# EAGLE design bus (EAGLE 4.16)
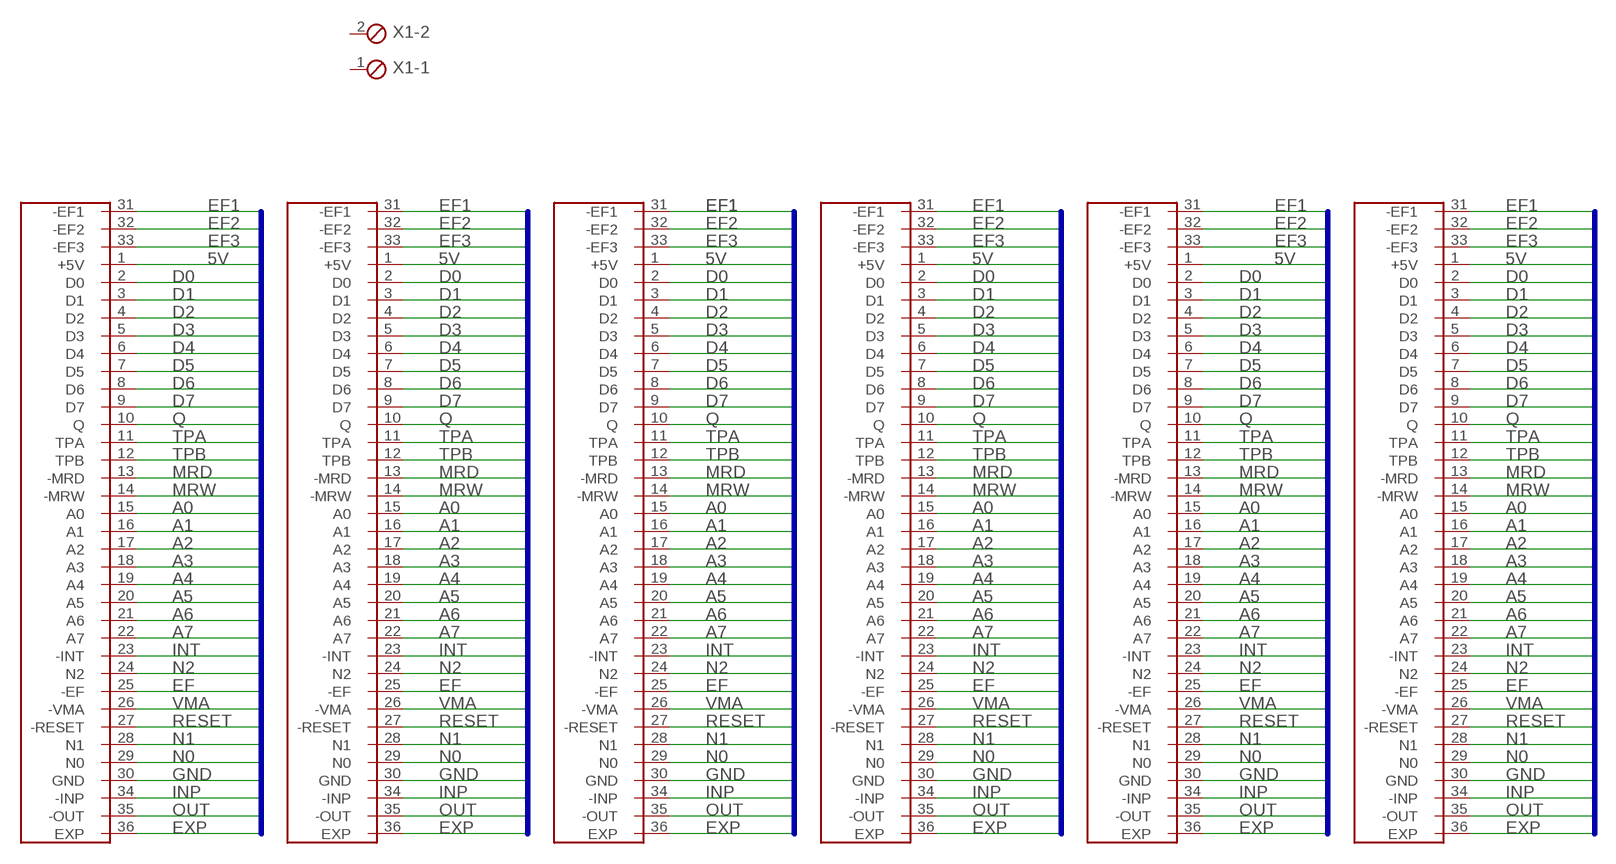
[diagram p0: schematic, sheet 1]

## Parts
U$1  C36A  [C36A]
U$2  C36A  [C36A]
U$3  C36A  [C36A]
U$4  C36A  [C36A]
U$5  C36A  [C36A]
U$6  C36A  [C36A]
X1  MPT2  [2POL254]

## Nets
5V: U$1.1(+5V) U$2.1(+5V) U$3.1(+5V) U$4.1(+5V) U$5.1(+5V) U$6.1(+5V)
A0: U$1.15(A0) U$2.15(A0) U$3.15(A0) U$4.15(A0) U$5.15(A0) U$6.15(A0)
A1: U$1.16(A1) U$2.16(A1) U$3.16(A1) U$4.16(A1) U$5.16(A1) U$6.16(A1)
A2: U$1.17(A2) U$2.17(A2) U$3.17(A2) U$4.17(A2) U$5.17(A2) U$6.17(A2)
A3: U$1.18(A3) U$2.18(A3) U$3.18(A3) U$4.18(A3) U$5.18(A3) U$6.18(A3)
A4: U$1.19(A4) U$2.19(A4) U$3.19(A4) U$4.19(A4) U$5.19(A4) U$6.19(A4)
A5: U$1.20(A5) U$2.20(A5) U$3.20(A5) U$4.20(A5) U$5.20(A5) U$6.20(A5)
A6: U$1.21(A6) U$2.21(A6) U$3.21(A6) U$4.21(A6) U$5.21(A6) U$6.21(A6)
A7: U$1.22(A7) U$2.22(A7) U$3.22(A7) U$4.22(A7) U$5.22(A7) U$6.22(A7)
D0: U$1.2(D0) U$2.2(D0) U$3.2(D0) U$4.2(D0) U$5.2(D0) U$6.2(D0)
D1: U$1.3(D1) U$2.3(D1) U$3.3(D1) U$4.3(D1) U$5.3(D1) U$6.3(D1)
D2: U$1.4(D2) U$2.4(D2) U$3.4(D2) U$4.4(D2) U$5.4(D2) U$6.4(D2)
D3: U$1.5(D3) U$2.5(D3) U$3.5(D3) U$4.5(D3) U$5.5(D3) U$6.5(D3)
D4: U$1.6(D4) U$2.6(D4) U$3.6(D4) U$4.6(D4) U$5.6(D4) U$6.6(D4)
D5: U$1.7(D5) U$2.7(D5) U$3.7(D5) U$4.7(D5) U$5.7(D5) U$6.7(D5)
D6: U$1.8(D6) U$2.8(D6) U$3.8(D6) U$4.8(D6) U$5.8(D6) U$6.8(D6)
D7: U$1.9(D7) U$2.9(D7) U$3.9(D7) U$4.9(D7) U$5.9(D7) U$6.9(D7)
EF: U$1.25(-EF) U$2.25(-EF) U$3.25(-EF) U$4.25(-EF) U$5.25(-EF) U$6.25(-EF)
EF1: U$1.31(-EF1) U$2.31(-EF1) U$3.31(-EF1) U$4.31(-EF1) U$5.31(-EF1) U$6.31(-EF1)
EF2: U$1.32(-EF2) U$2.32(-EF2) U$3.32(-EF2) U$4.32(-EF2) U$5.32(-EF2) U$6.32(-EF2)
EF3: U$1.33(-EF3) U$2.33(-EF3) U$3.33(-EF3) U$4.33(-EF3) U$5.33(-EF3) U$6.33(-EF3)
EXP: U$1.36(EXP) U$2.36(EXP) U$3.36(EXP) U$4.36(EXP) U$5.36(EXP) U$6.36(EXP)
GND: U$1.30(GND) U$2.30(GND) U$3.30(GND) U$4.30(GND) U$5.30(GND) U$6.30(GND)
INP: U$1.34(-INP) U$2.34(-INP) U$3.34(-INP) U$4.34(-INP) U$5.34(-INP) U$6.34(-INP)
INT: U$1.23(-INT) U$2.23(-INT) U$3.23(-INT) U$4.23(-INT) U$5.23(-INT) U$6.23(-INT)
MRD: U$1.13(-MRD) U$2.13(-MRD) U$3.13(-MRD) U$4.13(-MRD) U$5.13(-MRD) U$6.13(-MRD)
MRW: U$1.14(-MRW) U$2.14(-MRW) U$3.14(-MRW) U$4.14(-MRW) U$5.14(-MRW) U$6.14(-MRW)
N0: U$1.29(N0) U$2.29(N0) U$3.29(N0) U$4.29(N0) U$5.29(N0) U$6.29(N0)
N1: U$1.28(N1) U$2.28(N1) U$3.28(N1) U$4.28(N1) U$5.28(N1) U$6.28(N1)
N2: U$1.24(N2) U$2.24(N2) U$3.24(N2) U$4.24(N2) U$5.24(N2) U$6.24(N2)
OUT: U$1.35(-OUT) U$2.35(-OUT) U$3.35(-OUT) U$4.35(-OUT) U$5.35(-OUT) U$6.35(-OUT)
Q: U$1.10(Q) U$2.10(Q) U$3.10(Q) U$4.10(Q) U$5.10(Q) U$6.10(Q)
RESET: U$1.27(-RESET) U$2.27(-RESET) U$3.27(-RESET) U$4.27(-RESET) U$5.27(-RESET) U$6.27(-RESET)
TPA: U$1.11(TPA) U$2.11(TPA) U$3.11(TPA) U$4.11(TPA) U$5.11(TPA) U$6.11(TPA)
TPB: U$1.12(TPB) U$2.12(TPB) U$3.12(TPB) U$4.12(TPB) U$5.12(TPB) U$6.12(TPB)
VMA: U$1.26(-VMA) U$2.26(-VMA) U$3.26(-VMA) U$4.26(-VMA) U$5.26(-VMA) U$6.26(-VMA)
Unconnected: X1.1 X1.2

## Buses
5V,GND,D[0..7],Q,TPA,TPB,MRD,MRW,A[0..7],INT,EF,VMA,RESET,N0,N1,N2,EF1,EF2,EF3,INP,OUT,IOM

## Library data of the parts
U$1-U$6 = k1:C36A
X1 = con-phoenix-254:MPT2: PHOENIX CONNECTOR

## Board
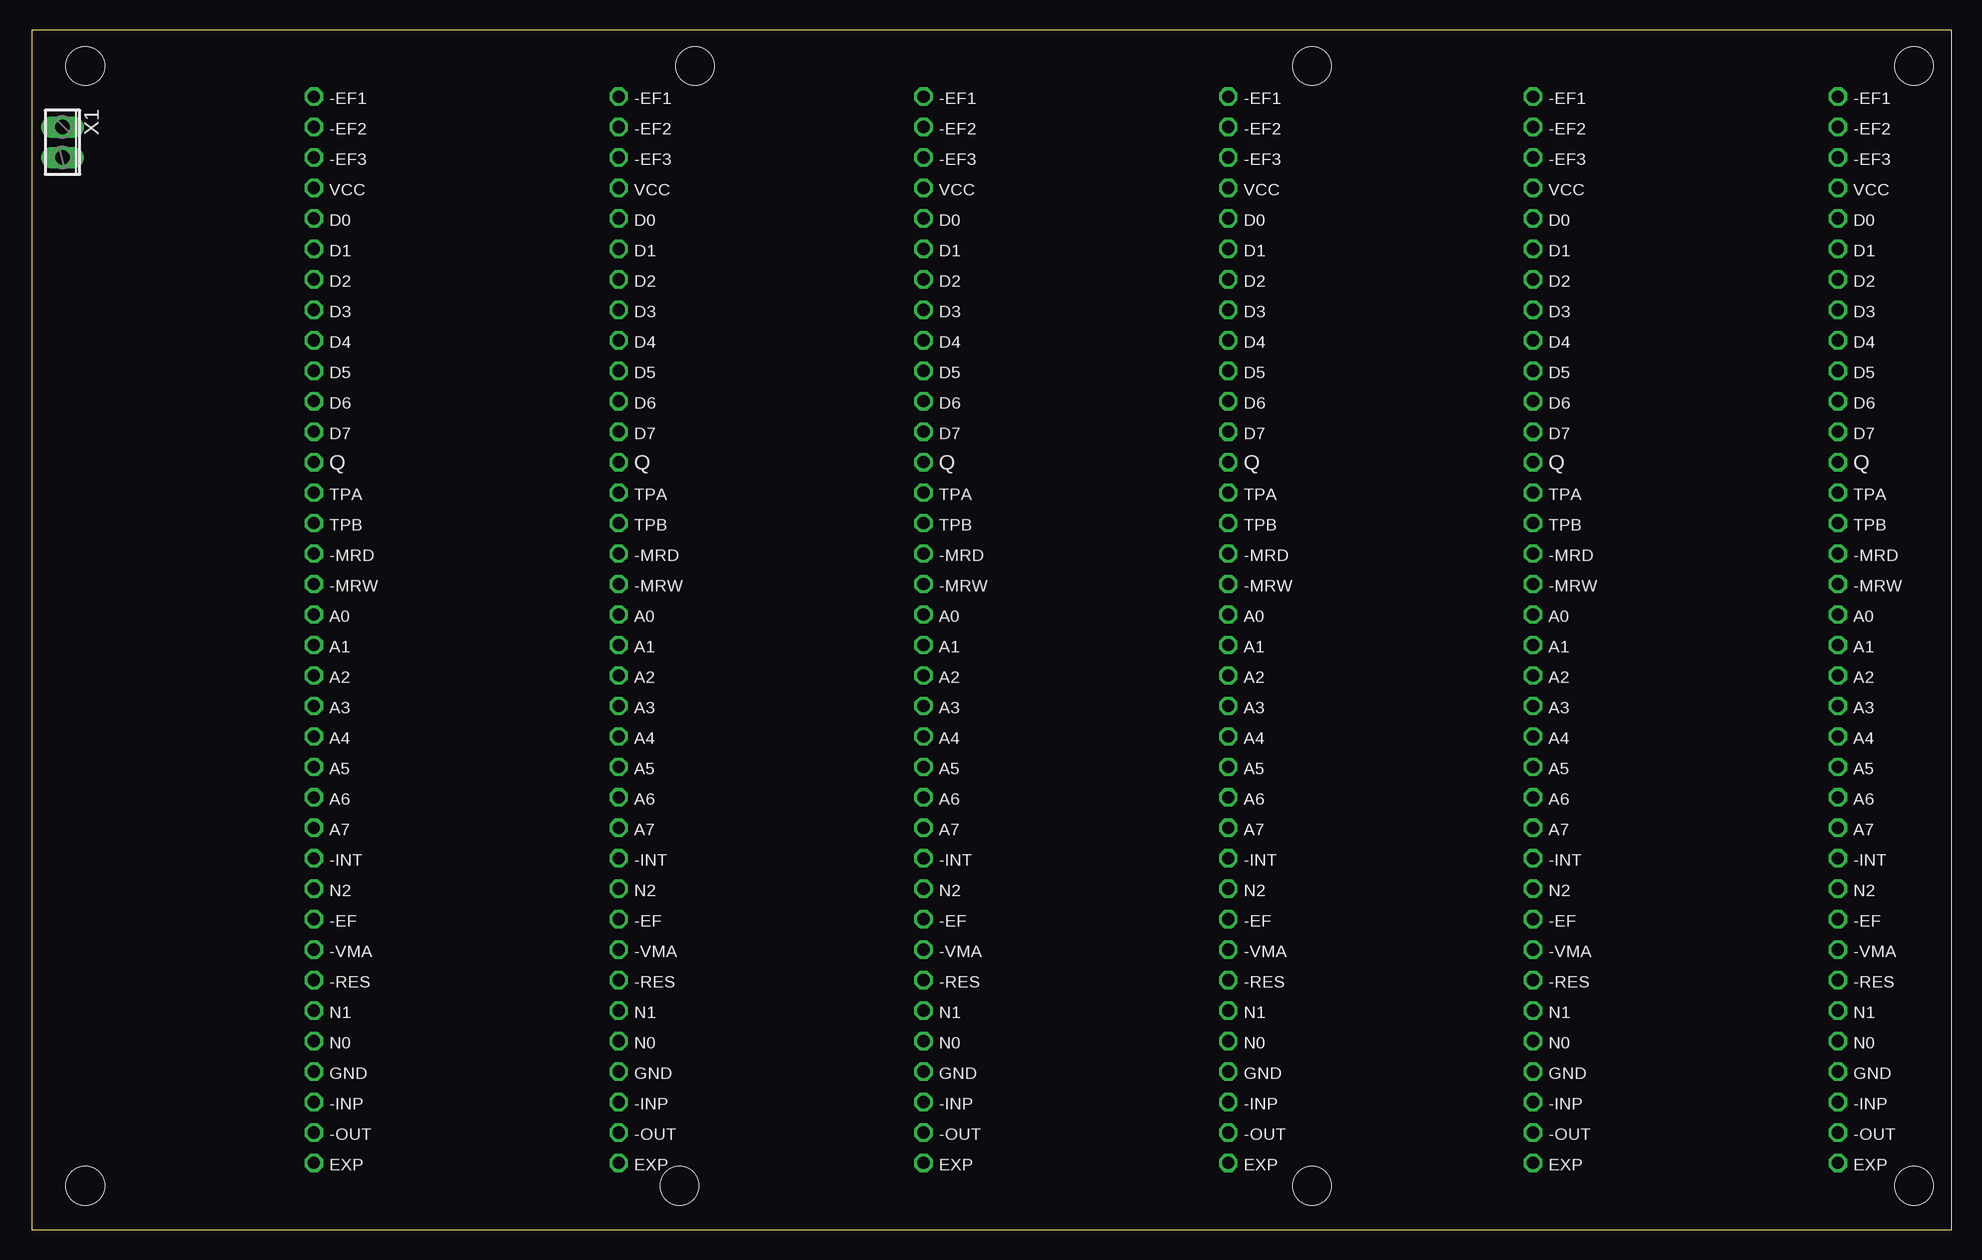
[diagram p1: board, top side]
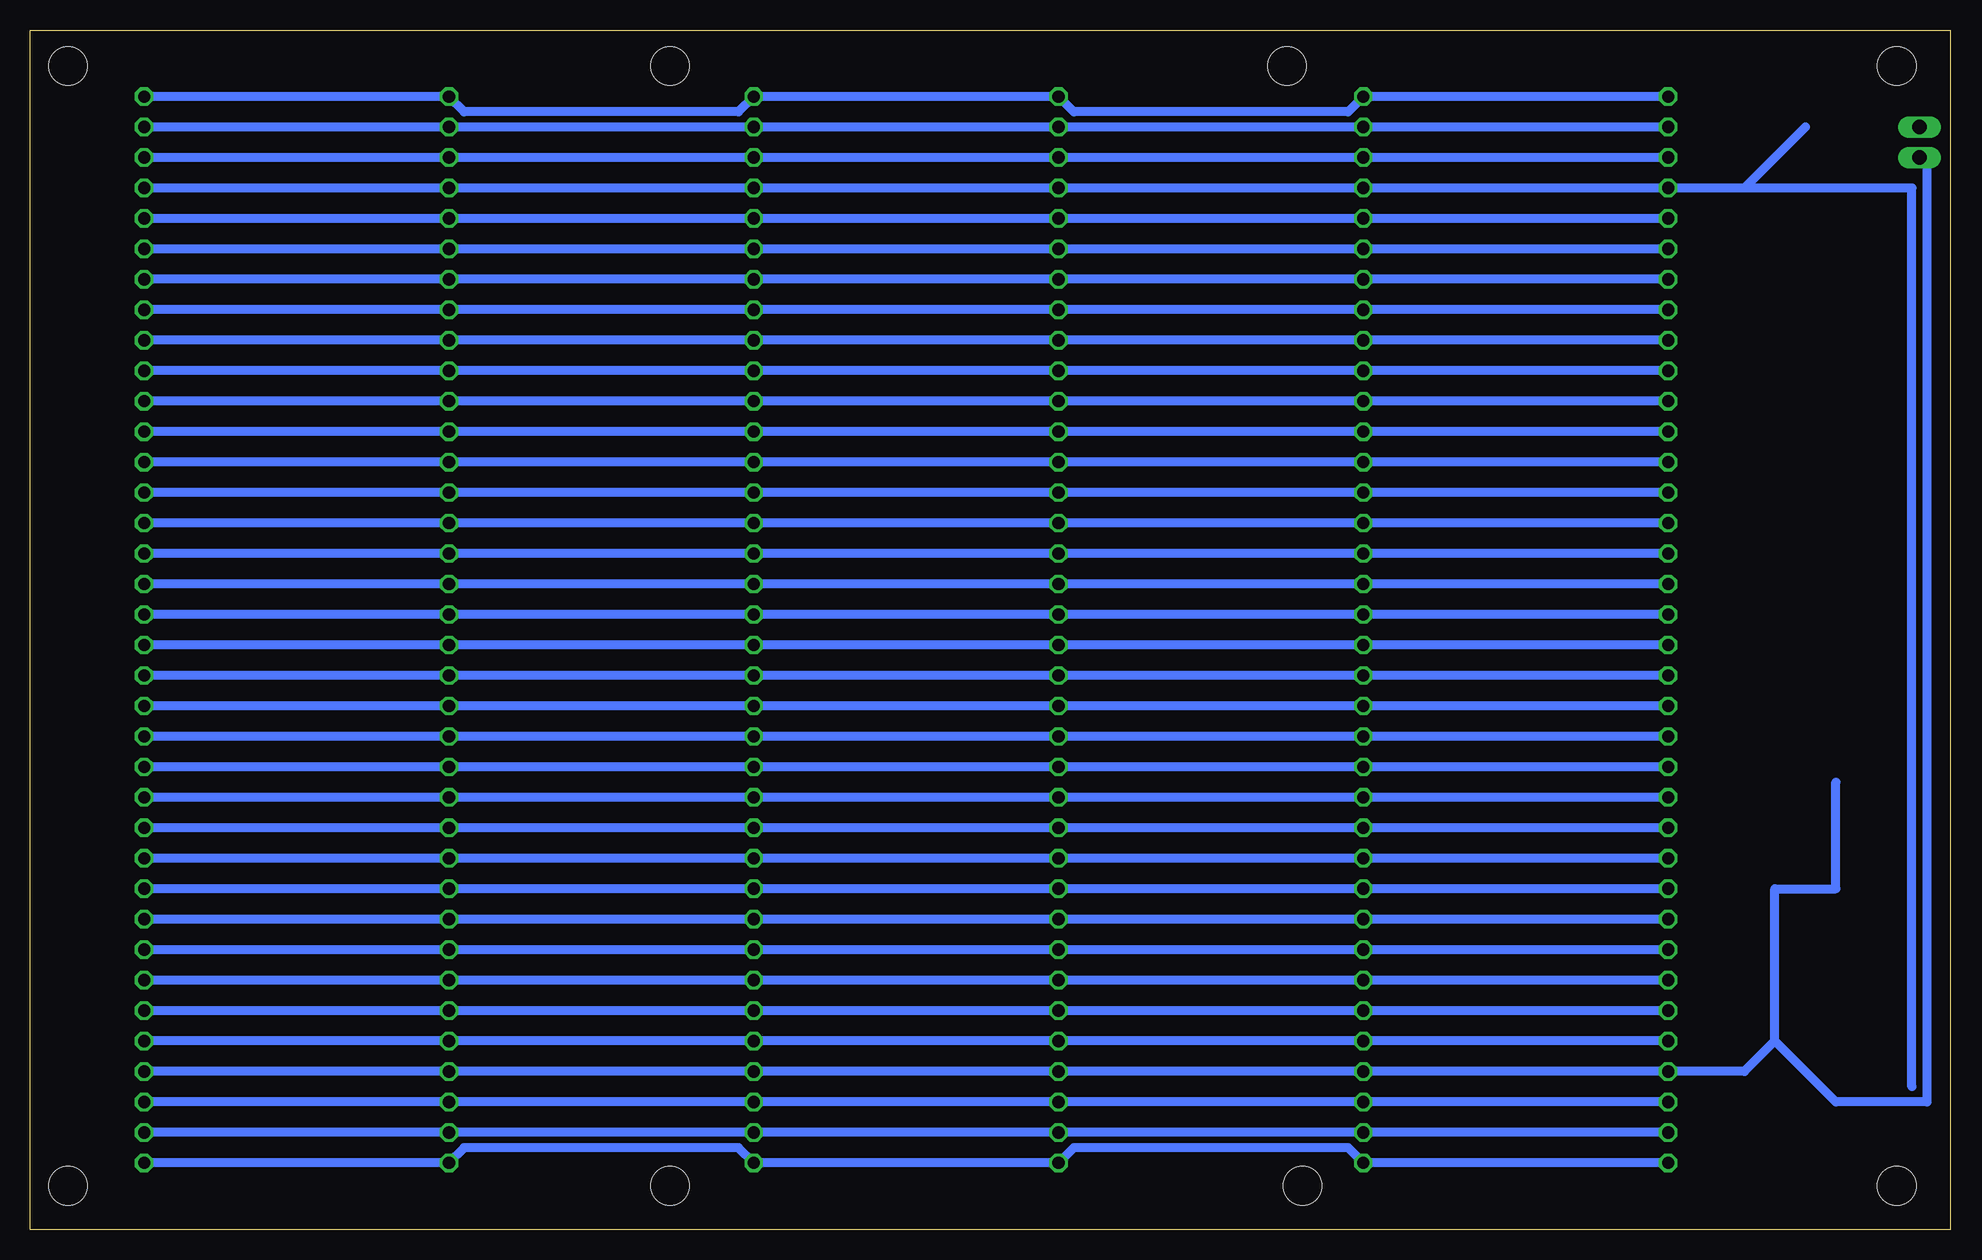
[diagram p2: board, bottom side, seen from below]

Size 160 x 100 mm. Coordinates in mm from the lower left corner, seen from the top.
Outline: 0,0 160,0 160,100 0,100 0,0
Copper layers (1*16): Top 0.035mm / dielectric 1.5mm / Bottom 0.035mm
Design rules "default": minimum track width 30mil, minimum drill 24mil, track to track 8mil, track to pad 8mil, pad to pad 8mil, via to via 8mil, smd to smd 8mil, copper to edge 40mil, drill to drill 8mil, minimum pad ring 10mil, minimum via ring 8mil, stop-mask expansion 4mil, vias tented up to drill 0mil, thermal gap 10mil
Holes 3.2 mm at 4.44,3.64 4.44,96.99 156.84,96.99 156.84,3.64 55.24,96.99 53.97,3.64 106.67,96.99 106.67,3.64
tRestrict: area 21.6,4.3 to 151.8,96.4; area 0.6,17 to 17.1,30.3

### Footprints (pad centres in the part's own frame; a part is rotated, then mirrored left to right if it is on the bottom)
C36A = drill 1.016 octagon: 1 -44.45,0; 2 -41.91,0; 3 -39.37,0; 4 -36.83,0; 5 -34.29,0; 6 -31.75,0; 7 -29.21,0; 8 -26.67,0; 9 -24.13,0; 10 -21.59,0; 11 -19.05,0; 12 -16.51,0; 13 -13.97,0; 14 -11.43,0; 15 -8.89,0; 16 -6.35,0; 17 -3.81,0; 18 -1.27,0; 19 1.27,0; 20 3.81,0; 21 6.35,0; 22 8.89,0; 23 11.43,0; 24 13.97,0; 25 16.51,0; 26 19.05,0; 27 21.59,0; 28 24.13,0; 29 26.67,0; 30 29.21,0; 31 -46.99,0; 32 -49.53,0; 33 -52.07,0; 34 31.75,0; 35 34.29,0; 36 36.83,0
2POL254 = drill 1.2 long: 1 -1.27,0; 2 1.27,0

### Placement (x,y rotation side)
U$1  23.49,42.38 270 top
U$2  48.89,42.38 270 top
U$3  74.29,42.38 270 top
U$4  99.69,42.38 270 top
U$5  125.09,42.38 270 top
U$6  150.49,42.38 270 top
X1  2.54,90.64 270 top

### Tracks (layer width: path | path; a pad name or v marks a point on that pad's centre or on a via)
5V
  Bottom 0.762: 3.17,11.9 3.17,86.83 17.14,86.83 | 17.14,86.83 U$1.1 U$2.1 U$3.1 U$4.1 U$5.1 U$6.1 | 17.14,86.83 12.06,91.91
A0
  Bottom 0.762: U$1.15 U$2.15 U$3.15 U$4.15 U$5.15 U$6.15
A1
  Bottom 0.762: U$1.16 U$2.16 U$3.16 U$4.16 U$5.16 U$6.16
A2
  Bottom 0.762: U$1.17 U$2.17 U$3.17 U$4.17 U$5.17 U$6.17
A3
  Bottom 0.762: U$1.18 U$2.18 U$3.18 U$4.18 U$5.18 U$6.18
A4
  Bottom 0.762: U$1.19 U$2.19 U$3.19 U$4.19 U$5.19 U$6.19
A5
  Bottom 0.762: U$1.20 U$2.20 U$3.20 U$4.20 U$5.20 U$6.20
A6
  Bottom 0.762: U$1.21 U$2.21 U$3.21 U$4.21 U$5.21 U$6.21
A7
  Bottom 0.762: U$1.22 U$2.22 U$3.22 U$4.22 U$5.22 U$6.22
D0
  Bottom 0.762: U$1.2 U$2.2 U$3.2 U$4.2 U$5.2 U$6.2
D1
  Bottom 0.762: U$1.3 U$2.3 U$3.3 U$4.3 U$5.3 U$6.3
D2
  Bottom 0.762: U$1.4 U$2.4 U$3.4 U$4.4 U$5.4 U$6.4
D3
  Bottom 0.762: U$1.5 U$2.5 U$3.5 U$4.5 U$5.5 U$6.5
D4
  Bottom 0.762: U$1.6 U$2.6 U$3.6 U$4.6 U$5.6 U$6.6
D5
  Bottom 0.762: U$1.7 U$2.7 U$3.7 U$4.7 U$5.7 U$6.7
D6
  Bottom 0.762: U$1.8 U$2.8 U$3.8 U$4.8 U$5.8 U$6.8
D7
  Bottom 0.762: U$1.9 U$2.9 U$3.9 U$4.9 U$5.9 U$6.9
EF
  Bottom 0.762: U$1.25 U$2.25 U$3.25 U$4.25 U$5.25 U$6.25
EF1
  Bottom 0.762: U$1.31 U$2.31 U$3.31 U$4.31 U$5.31 U$6.31
EF2
  Bottom 0.762: U$1.32 U$2.32 U$3.32 U$4.32 U$5.32 U$6.32
EF3
  Bottom 0.762: U$6.33 U$5.33 123.82,93.18 100.96,93.18 U$4.33 U$3.33 73.02,93.18 50.16,93.18 U$2.33 U$1.33
EXP
  Bottom 0.762: U$6.36 U$5.36 123.82,6.82 100.96,6.82 U$4.36 U$3.36 73.02,6.82 50.16,6.82 U$2.36 U$1.36
GND
  Bottom 0.762: 14.6,15.71 17.14,13.17 U$1.30 U$2.30 U$3.30 U$4.30 U$5.30 U$6.30 | 9.52,37.3 9.52,28.41 14.6,28.41 14.6,15.71 | 1.9,89.37 1.9,10.63 9.52,10.63 14.6,15.71
INP
  Bottom 0.762: U$1.34 U$2.34 U$3.34 U$4.34 U$5.34 U$6.34
INT
  Bottom 0.762: U$1.23 U$2.23 U$3.23 U$4.23 U$5.23 U$6.23
MRD
  Bottom 0.762: U$1.13 U$2.13 U$3.13 U$4.13 U$5.13 U$6.13
MRW
  Bottom 0.762: U$1.14 U$2.14 U$3.14 U$4.14 U$5.14 U$6.14
N0
  Bottom 0.762: U$1.29 U$2.29 U$3.29 U$4.29 U$5.29 U$6.29
N1
  Bottom 0.762: U$1.28 U$2.28 U$3.28 U$4.28 U$5.28 U$6.28
N2
  Bottom 0.762: U$1.24 U$2.24 U$3.24 U$4.24 U$5.24 U$6.24
OUT
  Bottom 0.762: U$1.35 U$2.35 U$3.35 U$4.35 U$5.35 U$6.35
Q
  Bottom 0.762: U$1.10 U$2.10 U$3.10 U$4.10 U$5.10 U$6.10
RESET
  Bottom 0.762: U$1.27 U$2.27 U$3.27 U$4.27 U$5.27 U$6.27
TPA
  Bottom 0.762: U$1.11 U$2.11 U$3.11 U$4.11 U$5.11 U$6.11
TPB
  Bottom 0.762: U$1.12 U$2.12 U$3.12 U$4.12 U$5.12 U$6.12
VMA
  Bottom 0.762: U$1.26 U$2.26 U$3.26 U$4.26 U$5.26 U$6.26